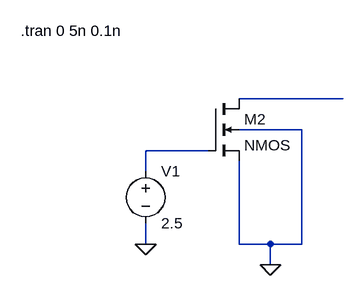
[diagram p0: schematic Exercise 8.asc]
Exercise 8.asc, the LTspice schematic file:
Version 4
SHEET 1 880 688
WIRE 336 416 176 416
WIRE 272 464 176 464
WIRE 128 496 32 496
WIRE 32 528 32 496
WIRE 32 640 32 608
WIRE 176 640 176 512
WIRE 224 640 176 640
WIRE 272 640 272 464
WIRE 272 640 224 640
WIRE 224 672 224 640
FLAG 32 640 0
FLAG 224 672 0
SYMBOL nmos4 128 416 R0
SYMATTR InstName M2
SYMATTR Value2 l=1 w=100
SYMBOL Voltage 32 512 R0
SYMATTR InstName V1
SYMATTR Value 2.5
TEXT -160 312 Left 2 !.tran 0 5n 0.1n

The netlist it stands for:
* Exercise 8.asc
M2 N001 N002 0 0 NMOS l=1 w=100
V1 N002 0 2.5
.model NMOS NMOS
.model PMOS PMOS
.lib standard.mos
.tran 0 5n 0.1n
.backanno
.end